# Altium schematic sheet Sensorler.SchDoc
size A4; SheetNumber: 4; SheetTotal: 6
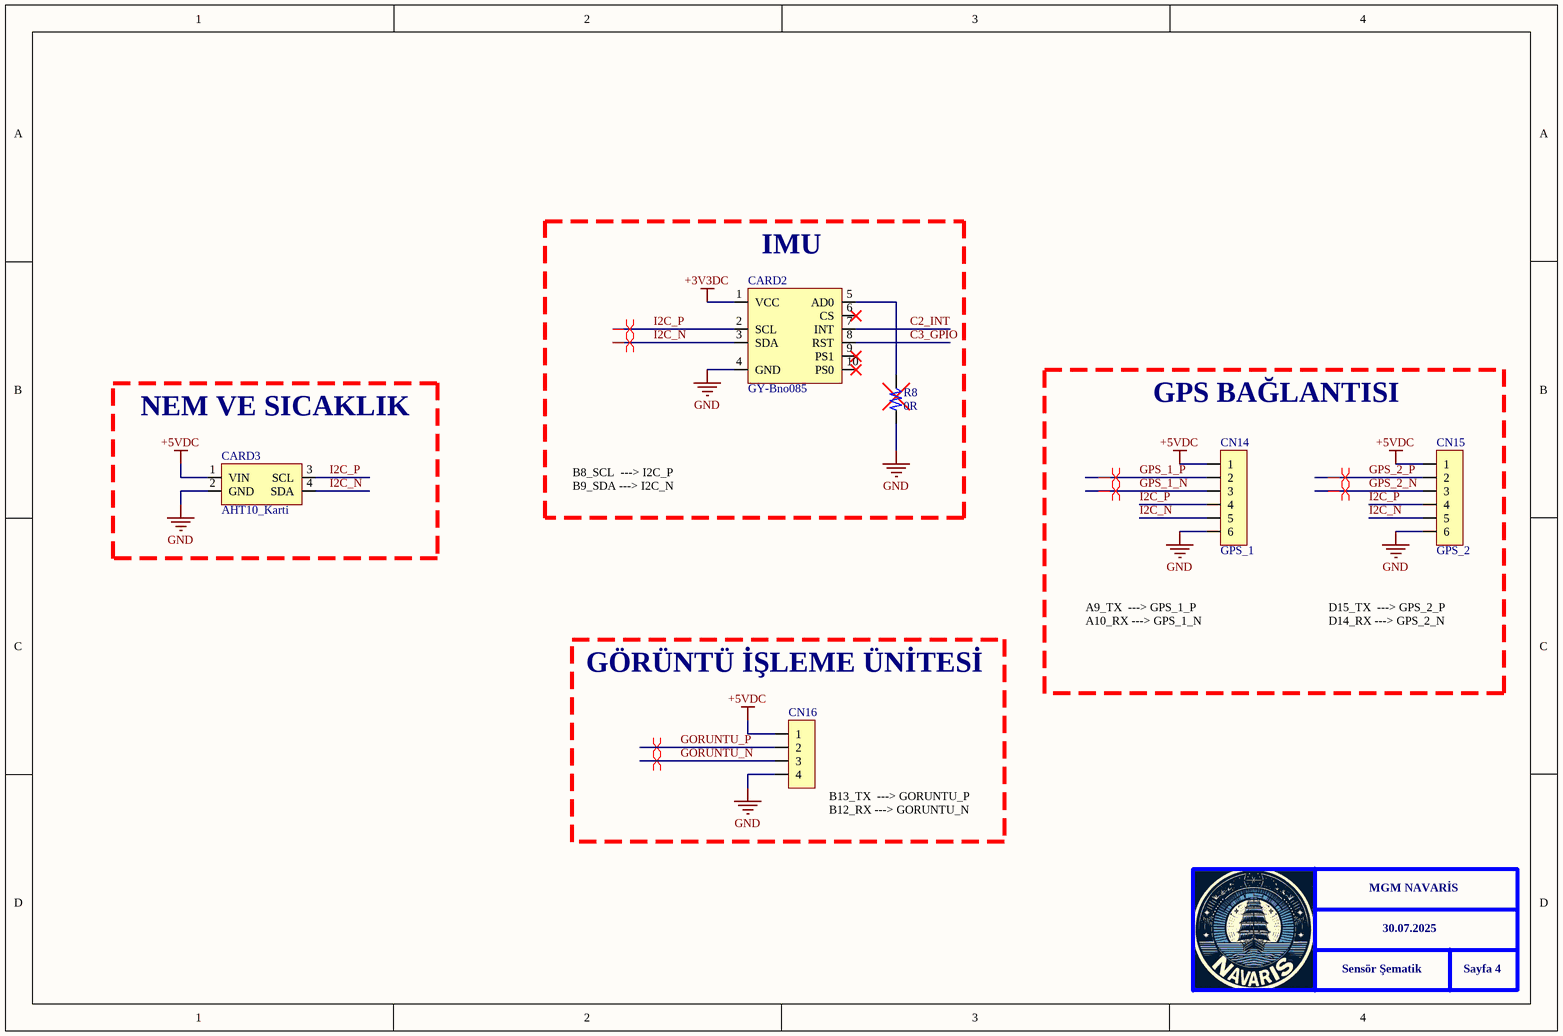
[diagram p0: Sensorler.SchDoc]

## Parts
CARD2  GY-Bno085  [Bno085_Kartı]
CARD3  AHT10_Karti  [AHT10_Karti_PCB]
CN14  GPS_1  [6_Pin_JST_Male]
CN15  GPS_2  [6_Pin_JST_Male]
CN16  4_Pin_JST_Male  [4_Pin_JST_Male]  (value not drawn)
R8  0R  [1206_RES]

## Blocks framed on the sheet
IMU: CARD2 R8
NEM VE SICAKLIK: CARD3
GPS BAĞLANTISI: CN14 CN15
GÖRÜNTÜ İŞLEME ÜNİTESİ: CN16

## Nets
+3V3DC: CARD2.1(VCC)
+5VDC: CARD3.1(VIN) CN14.1 CN15.1 CN16.1
GND: CARD2.4(GND) CARD3.2(GND) CN14.6 CN15.6 CN16.4 R8.1
C2_INT: CARD2.7(INT)
C3_GPIO: CARD2.8(RST)
GORUNTU_N: CN16.3
GORUNTU_P: CN16.2
GPS_1_N: CN14.3
GPS_1_P: CN14.2
GPS_2_N: CN15.3
GPS_2_P: CN15.2
I2C_N: CARD2.3(SDA) CARD3.4(SDA) CN14.5 CN15.5
I2C_P: CARD2.2(SCL) CARD3.3(SCL) CN14.4 CN15.4
NetCARD2_5: CARD2.5(AD0) R8.2

Not connected (* = marked no-connect by the designer): CARD2 6(CS)* 9(PS1)* 10(PS0)*

## Layout directives
differential pair; net class DIFF_GORUNTU: GORUNTU_N, GORUNTU_P
differential pair; net class DIFF_GPS_1: GPS_1_N, GPS_1_P
differential pair; net class DIFF_GPS_2: GPS_2_N, GPS_2_P
differential pair; net class DIFF_IMU: I2C_N, I2C_P

## Notes on the sheet
- B8_SCL  ---> I2C_P
  B9_SDA ---> I2C_N
- A9_TX  ---> GPS_1_P
  A10_RX ---> GPS_1_N
- D15_TX  ---> GPS_2_P
  D14_RX ---> GPS_2_N
- (near CN16) B13_TX  ---> GORUNTU_P
  B12_RX ---> GORUNTU_N
- MGM NAVARİS
- Sensör Şematik
- 30.07.2025
- Sayfa 4

## Library data of the parts
CARD2 = GY-Bno085: GY-BNO080 BNO085 9-Axis High Precision Acceleration and Gyro Sensor; ComponentLink1Description: Ürün Linki; ComponentLink1URL: https://www.motorobit.com/gy-bno080-bno085-9-eksen-yuksek-hassasiyetli-ivme-ve-gyro-sensoru
CARD3 = AHT10_Karti: Temperature and humidity sensor / Fully calibrated / • Digital output, I2C interface / • Excellent long-term stability / • SMD package reflow solderable / • Fast response and strong anti-interference ability; ComponentLink1Description: Product Datasheet; ComponentLink1URL: https://robu.in/wp-content/uploads/2021/01/AHT10.pdf; ComponentLink2Description: Product Datasheet 2; ComponentLink2URL: https://esphome.io/components/sensor/aht10.html
CN14 CN15 = 6_Pin_JST_Male
R8 = 1206_RES